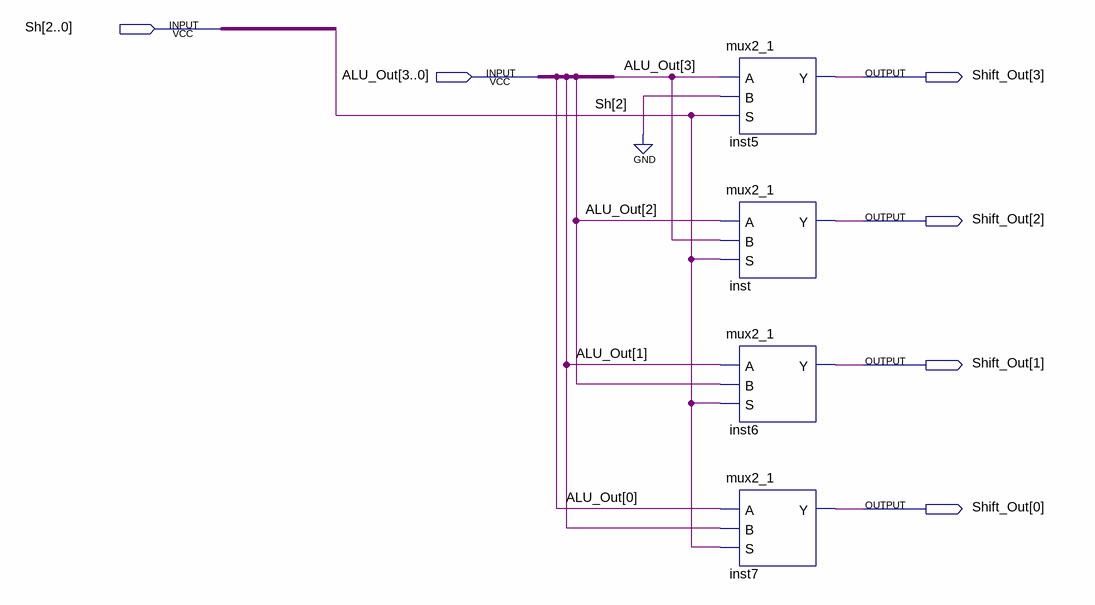
[diagram p0: schematic sheet]
// Quartus schematic shifter.bdf as structural Verilog: 4 symbols, 6 pins
module shifter (
  input  [2:0] Sh,
  input  [3:0] ALU_Out,
  output [3:0] Shift_Out
);

  mux2_1 inst5 (.A(ALU_Out[3]), .B(1'b0), .S(Sh[2]), .Y(Shift_Out[3]));
  mux2_1 inst (.A(ALU_Out[2]), .B(ALU_Out[3]), .S(Sh[2]), .Y(Shift_Out[2]));
  mux2_1 inst6 (.A(ALU_Out[1]), .B(ALU_Out[2]), .S(Sh[2]), .Y(Shift_Out[1]));
  mux2_1 inst7 (.A(ALU_Out[0]), .B(ALU_Out[1]), .S(Sh[2]), .Y(Shift_Out[0]));
endmodule
